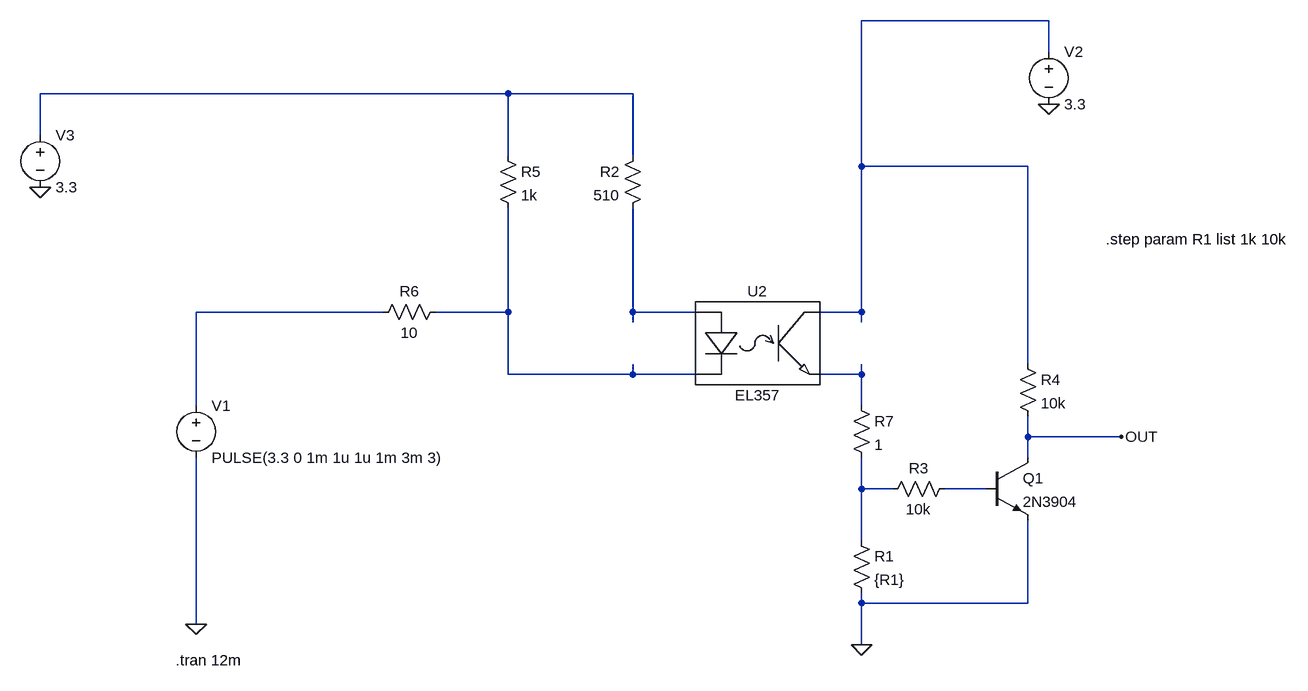
[diagram p0: schematic opto.asc]
opto.asc, the LTspice schematic file:
Version 4
SHEET 1 1052 680
WIRE 656 -368 368 -368
WIRE 656 -320 656 -368
WIRE -176 -256 -896 -256
WIRE 16 -256 -176 -256
WIRE -896 -192 -896 -256
WIRE -176 -160 -176 -256
WIRE 16 -160 16 -256
WIRE 368 -144 368 -368
WIRE 624 -144 368 -144
WIRE -368 80 -656 80
WIRE -176 80 -176 -80
WIRE -176 80 -288 80
WIRE 16 80 16 -80
WIRE 112 80 16 80
WIRE 368 80 368 -144
WIRE 368 80 304 80
WIRE 16 96 16 80
WIRE 368 96 368 80
WIRE 624 160 624 -144
WIRE -176 176 -176 80
WIRE 16 176 16 160
WIRE 16 176 -176 176
WIRE 112 176 16 176
WIRE 368 176 368 160
WIRE 368 176 304 176
WIRE -656 224 -656 80
WIRE 368 224 368 176
WIRE 624 272 624 240
WIRE 768 272 624 272
WIRE 624 304 624 272
WIRE 368 352 368 304
WIRE 416 352 368 352
WIRE 560 352 496 352
WIRE 368 432 368 352
WIRE 368 528 368 512
WIRE 624 528 624 400
WIRE 624 528 368 528
WIRE -656 560 -656 304
WIRE 368 592 368 528
FLAG -656 560 0
FLAG 656 -240 0
FLAG 368 592 0
FLAG 768 272 OUT
FLAG -896 -112 0
SYMBOL res 352 416 R0
SYMATTR InstName R1
SYMATTR Value {R1}
SYMBOL res 32 -176 M0
SYMATTR InstName R2
SYMATTR Value 510
SYMBOL voltage -656 208 R0
WINDOW 123 0 0 Left 0
WINDOW 39 0 0 Left 0
SYMATTR InstName V1
SYMATTR Value PULSE(3.3 0 1m 1u 1u 1m 3m 3)
SYMBOL voltage 656 -336 R0
WINDOW 123 0 0 Left 0
WINDOW 39 0 0 Left 0
SYMATTR InstName V2
SYMATTR Value 3.3
SYMBOL res 512 336 R90
WINDOW 0 0 56 VBottom 2
WINDOW 3 32 56 VTop 2
SYMATTR InstName R3
SYMATTR Value 10k
SYMBOL npn 560 304 R0
SYMATTR InstName Q1
SYMATTR Value 2N3904
SYMBOL res 608 144 R0
SYMATTR InstName R4
SYMATTR Value 10k
SYMBOL EL357 208 128 R0
SYMATTR InstName U2
SYMBOL voltage -896 -208 R0
WINDOW 123 0 0 Left 0
WINDOW 39 0 0 Left 0
SYMATTR InstName V3
SYMATTR Value 3.3
SYMBOL res -192 -176 R0
SYMATTR InstName R5
SYMATTR Value 1k
SYMBOL res -272 64 R90
WINDOW 0 0 56 VBottom 2
WINDOW 3 32 56 VTop 2
SYMATTR InstName R6
SYMATTR Value 10
SYMBOL res 352 208 R0
SYMATTR InstName R7
SYMATTR Value 1
TEXT -688 616 Left 2 !.tran 12m
TEXT 744 -32 Left 2 !.step param R1 list 1k 10k

The netlist it stands for:
* opto.asc
R1 N007 0 {R1}
R2 N002 N005 510
V1 N003 0 PULSE(3.3 0 1m 1u 1u 1m 3m 3)
V2 N001 0 3.3
R3 N008 N007 10k
Q1 OUT N008 0 0 2N3904
R4 N001 OUT 10k
XU2 N005 N004 N006 N001 pc357nt  ; pins A K E C
V3 N002 0 3.3
R5 N002 N004 1k
R6 N004 N003 10
R7 N006 N007 1
.model NPN NPN
.model PNP PNP
.lib standard.bjt
.tran 12m
.step param R1 list 1k 10k
.lib pc357nt.lib
.backanno
.end